# EAGLE design UWB nRF52840 DW3000 V1.1 (EAGLE 6.1)
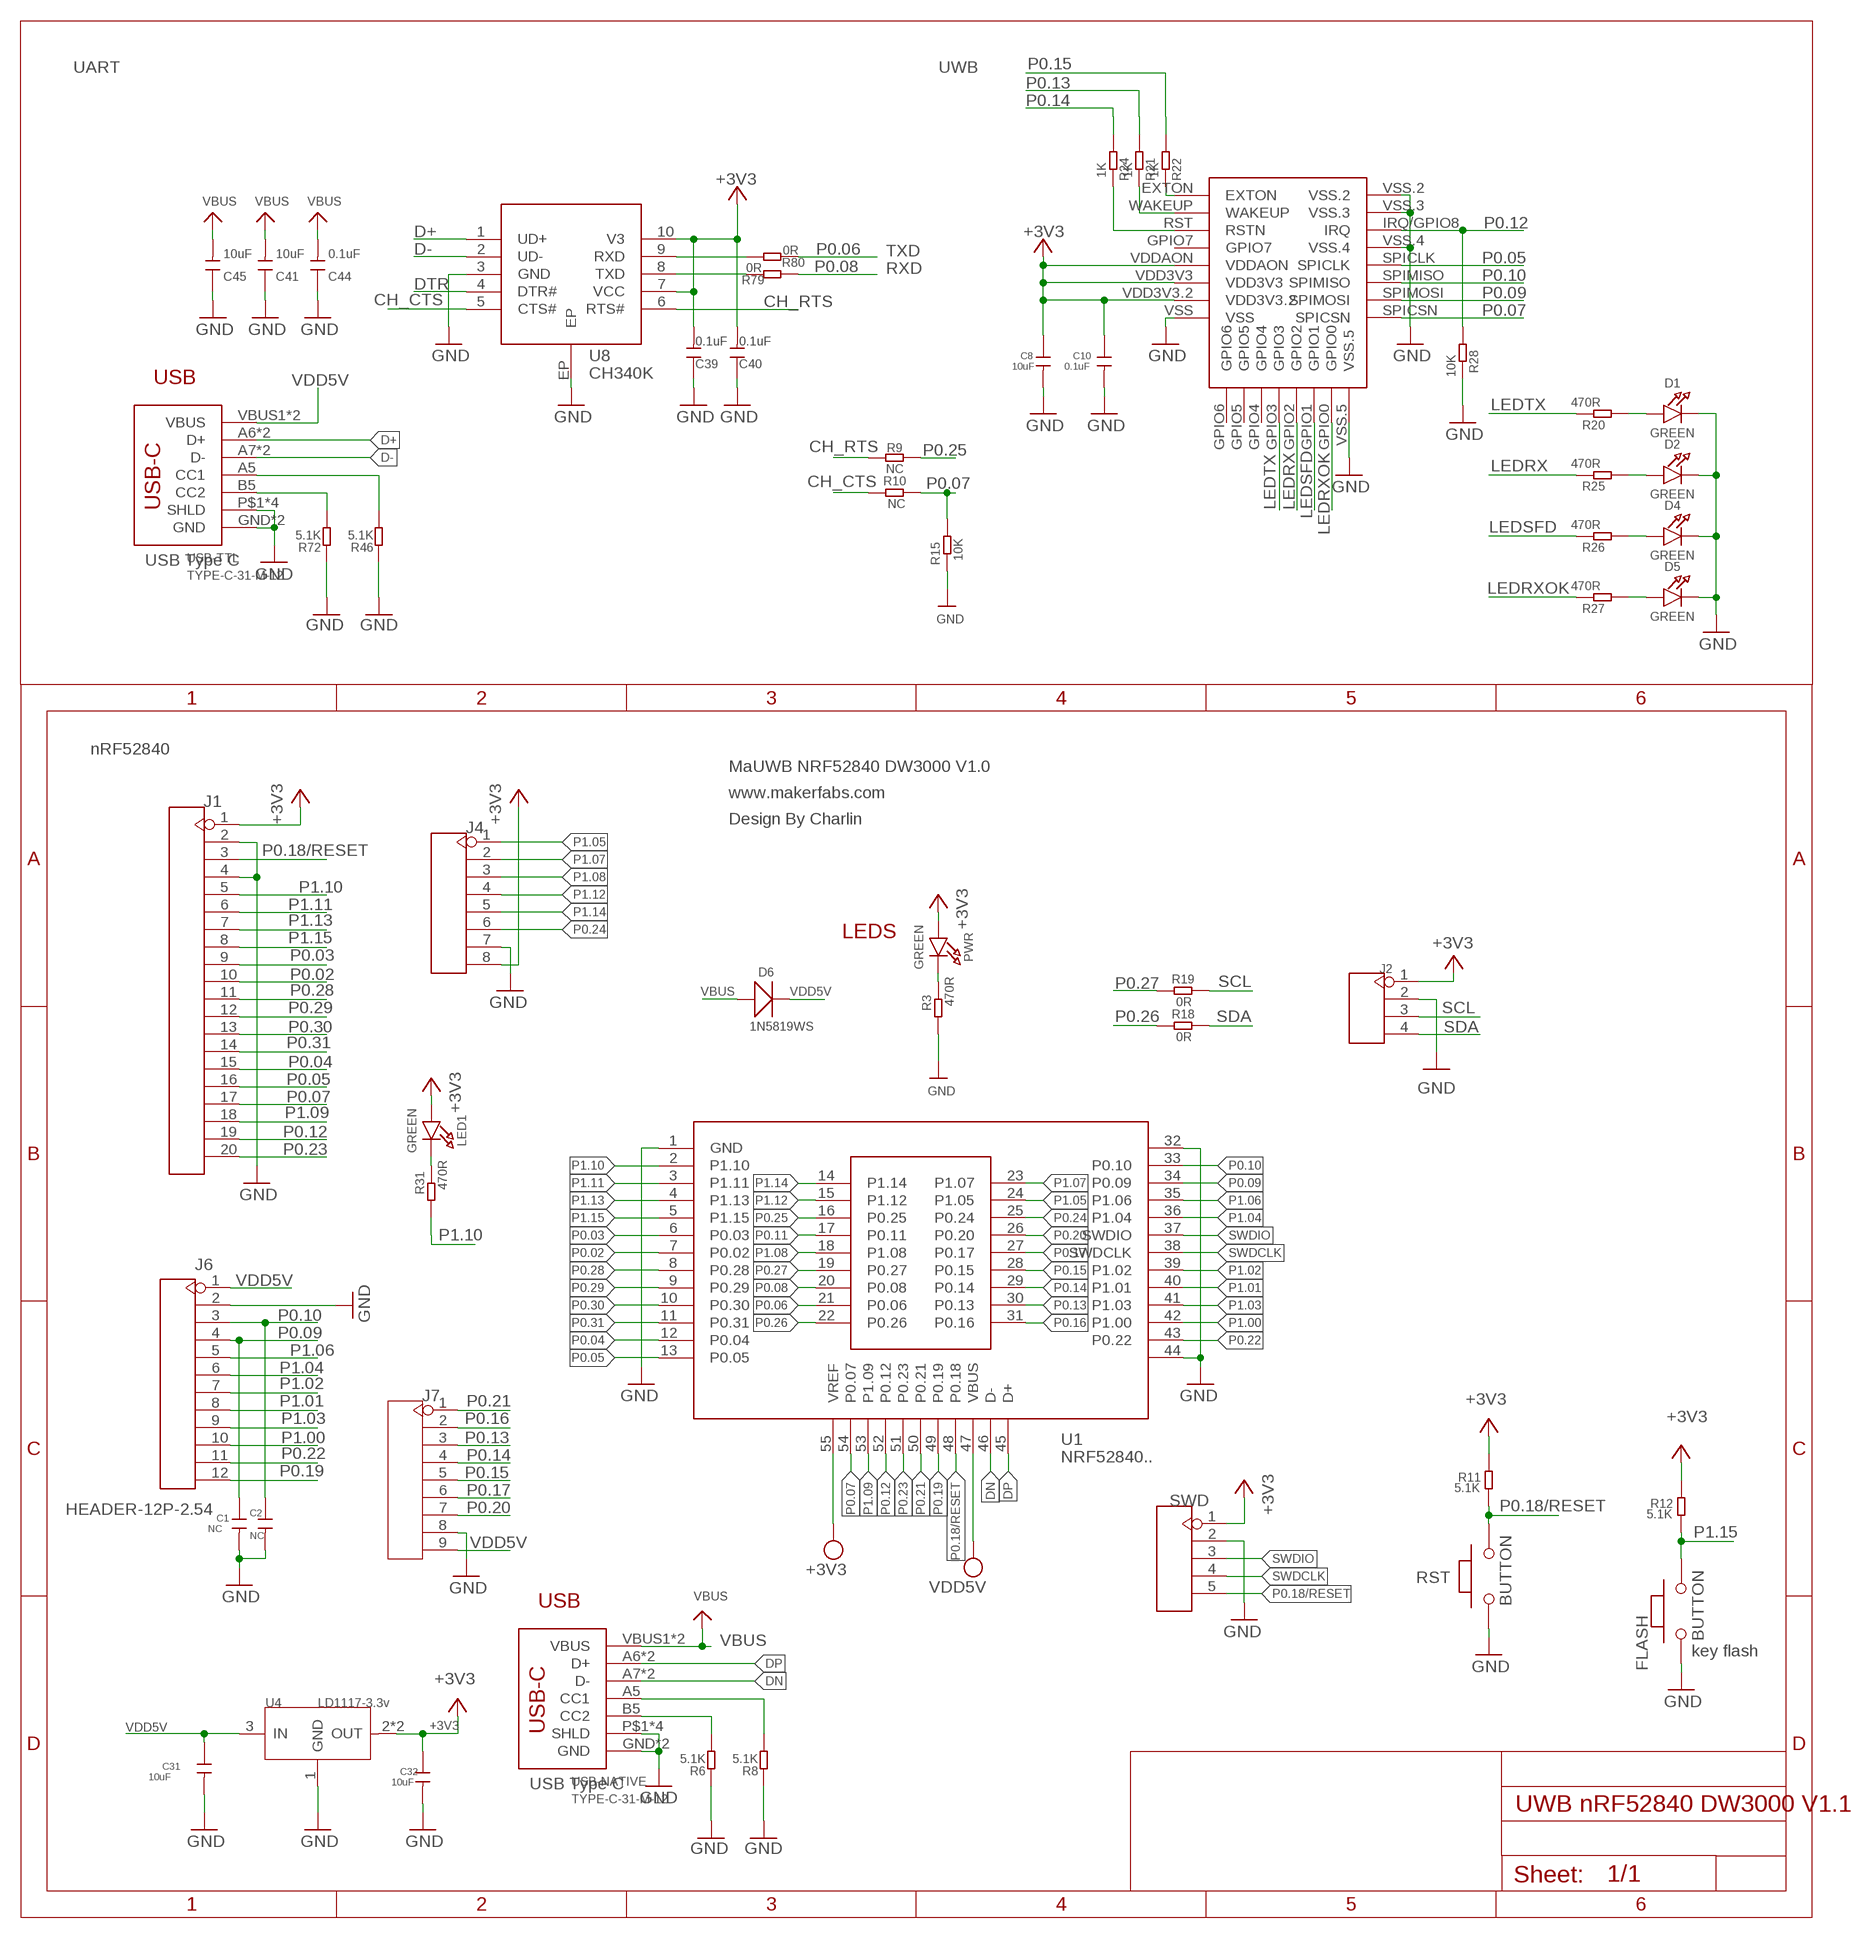
[diagram p0: schematic, sheet 1]

## Parts
C1  NC  C-0603  [C0603]
C2  NC  C-0603  [C0603]
C8  10uF  C-0603  [C0603]
C10  0.1uF  C-0603  [C0603]
C31  10uF  C-0603  [C0603]
C32  10uF  C-0603  [C0603]
C39  0.1uF  DISCRETE_C-0603  [DISCRETE_C0603]
C40  0.1uF  DISCRETE_C-0603  [DISCRETE_C0603]
C41  10uF  DISCRETE_C-0603  [DISCRETE_C0603]
C44  0.1uF  DISCRETE_C-0603  [DISCRETE_C0603]
C45  10uF  DISCRETE_C-0603  [DISCRETE_C0603]
D1  GREEN  LED0805_NOOUTLINE  [CHIPLED_0805_NOOUTLINE]
D2  GREEN  LED0805_NOOUTLINE  [CHIPLED_0805_NOOUTLINE]
D4  GREEN  LED0805_NOOUTLINE  [CHIPLED_0805_NOOUTLINE]
D5  GREEN  LED0805_NOOUTLINE  [CHIPLED_0805_NOOUTLINE]
D6  1N5819WS  D'0805'  [SOD323]
FLASH  BUTTON  PB157  [157SW]
J1  HEADER-20P-2.54  [20P-2.54]
J2  HEADER-4P-60/35MILROUND  [4P-65/35ROUND]
J4  HEADER-8P-2.54  [8P-2.54]
J6  HEADER-12P-2.54  [12P-2.54]
J7  HEADER-9P-2.54  [9P-2.54]
LED1  GREEN  LED0805_NOOUTLINE  [CHIPLED_0805_NOOUTLINE]
PWR  GREEN  LED0805_NOOUTLINE  [CHIPLED_0805_NOOUTLINE]
R3  470R  R-0603  [R0603]
R6  5.1K  DISCRETE_R-0603  [DISCRETE_R0603]
R8  5.1K  DISCRETE_R-0603  [DISCRETE_R0603]
R9  NC  R-0603  [R0603]
R10  NC  R-0603  [R0603]
R11  5.1K  R-0603  [R0603]
R12  5.1K  R-0603  [R0603]
R15  10K  R-0603  [R0603]
R18  0R  R-0603  [R0603]
R19  0R  R-0603  [R0603]
R20  470R  R-0603  [R0603]
R21  1K  R-0603  [R0603]
R22  1K  R-0603  [R0603]
R24  1K  R-0603  [R0603]
R25  470R  R-0603  [R0603]
R26  470R  R-0603  [R0603]
R27  470R  R-0603  [R0603]
R28  10K  R-0603  [R0603]
R31  470R  R-0603  [R0603]
R46  5.1K  DISCRETE_R-0603  [DISCRETE_R0603]
R72  5.1K  DISCRETE_R-0603  [DISCRETE_R0603]
R79  0R  R-0603  [R0603]
R80  0R  R-0603  [R0603]
RST  BUTTON  PB157  [157SW]
SWD  HEADER-5P-2.54  [5P-2.54]
U1  NRF52840..  [NRF52840..]
U4  LD1117-3.3v  LD1117'SOT89'  [SOT89]
U5  DWM1000  [DWM1000]
U8  CH340K  [ESOP-10-EP-150MIL]
USB-NATIVE  TYPE-C-31-M-12  [TYPE-C-31-M-12]
USB-TTL  TYPE-C-31-M-12  [TYPE-C-31-M-12]

## Nets
+3V3: C8.1 C10.1 C32.1 C39.2 C40.2 J1.1 J2.1 J4.8 LED1.A PWR.A R11.2 R12.2 SWD.1 U1.55(VREF) U4.2(OUT) U4.4(OUT) U5.VDD3V3 U5.VDD3V3.2 U5.VDDAON U8.7(VCC) U8.10(V3)
CH_CTS: R10.2 U8.5(CTS#)
CH_RTS: R9.2 U8.6(RTS#)
D+: U8.1(UD+) USB-TTL.A6(D+) USB-TTL.B6(D+)
D-: U8.2(UD-) USB-TTL.A7(D-) USB-TTL.B7(D-)
DN: U1.46(D-) USB-NATIVE.A7(D-) USB-NATIVE.B7(D-)
DP: U1.45(D+) USB-NATIVE.A6(D+) USB-NATIVE.B6(D+)
DTR: U8.4(DTR#)
GND: C1.2 C2.2 C8.2 C10.2 C31.2 C32.2 C39.1 C40.1 C41.1 C44.1 C45.1 D1.C D2.C D4.C D5.C FLASH.1 J1.2 J1.4 J2.2 J4.7 J6.2 J7.8 R3.2 R6.1 R8.1 R15.2 R28.1 R46.1 R72.1 RST.1 SWD.2 U1.1(GND) U1.32 U1.44 U4.1(GND) U5.VSS U5.VSS.2 U5.VSS.3 U5.VSS.4 U5.VSS.5 U8.3(GND) U8.EP USB-NATIVE.GND USB-NATIVE.GND2(GND) USB-NATIVE.P$1(SHLD) USB-NATIVE.P$2(SHLD) USB-NATIVE.P$3(SHLD) USB-NATIVE.P$4(SHLD) USB-TTL.GND USB-TTL.GND2(GND) USB-TTL.P$1(SHLD) USB-TTL.P$2(SHLD) USB-TTL.P$3(SHLD) USB-TTL.P$4(SHLD)
LEDRX: R25.1 U5.GPIO2
LEDRXOK: R27.1 U5.GPIO0
LEDSFD: R26.1 U5.GPIO1
LEDTX: R20.1 U5.GPIO3
N$1: LED1.C R31.1
N$2: D1.A R20.2
N$4: D2.A R25.2
N$5: PWR.C R3.1
N$6: D4.A R26.2
N$7: D5.A R27.2
N$10: R22.1 U5.EXTON
N$11: R21.1 U5.WAKEUP
N$12: R24.1 U5.RST(RSTN)
N$13: R46.2 USB-TTL.A5(CC1)
N$14: R72.2 USB-TTL.B5(CC2)
N$15: R8.2 USB-NATIVE.A5(CC1)
N$21: R6.2 USB-NATIVE.B5(CC2)
N$36: R80.2 U8.9(RXD)
N$37: R79.2 U8.8(TXD)
P0.02: J1.10 U1.7(P0.02)
P0.03: J1.9 U1.6(P0.03)
P0.04: J1.15 U1.12(P0.04)
P0.05: J1.16 U1.13(P0.05) U5.SPICLK
P0.06: R80.1 U1.21(P0.06)
P0.07: J1.17 R10.1 R15.1 U1.54(P0.07) U5.SPICSN
P0.08: R79.1 U1.20(P0.08)
P0.09: C1.1 J6.4 U1.34(P0.09) U5.SPIMOSI
P0.10: C2.1 J6.3 U1.33(P0.10) U5.SPIMISO
P0.11: U1.17(P0.11)
P0.12: J1.19 R28.2 U1.52(P0.12) U5.IRQ/GPIO8(IRQ)
P0.13: J7.3 R21.2 U1.30(P0.13)
P0.14: J7.4 R24.2 U1.29(P0.14)
P0.15: J7.5 R22.2 U1.28(P0.15)
P0.16: J7.2 U1.31(P0.16)
P0.17: J7.6 U1.27(P0.17)
P0.18/RESET: J1.3 R11.1 RST.2 SWD.5 U1.48(P0.18)
P0.19: J6.12 U1.49(P0.19)
P0.20: J7.7 U1.26(P0.20)
P0.21: J7.1 U1.50(P0.21)
P0.22: J6.11 U1.43(P0.22)
P0.23: J1.20 U1.51(P0.23)
P0.24: J4.6 U1.25(P0.24)
P0.25: R9.1 U1.16(P0.25)
P0.26: R18.2 U1.22(P0.26)
P0.27: R19.2 U1.19(P0.27)
P0.28: J1.11 U1.8(P0.28)
P0.29: J1.12 U1.9(P0.29)
P0.30: J1.13 U1.10(P0.30)
P0.31: J1.14 U1.11(P0.31)
P1.00: J6.10 U1.42(P1.00)
P1.01: J6.8 U1.40(P1.01)
P1.02: J6.7 U1.39(P1.02)
P1.03: J6.9 U1.41(P1.03)
P1.04: J6.6 U1.36(P1.04)
P1.05: J4.1 U1.24(P1.05)
P1.06: J6.5 U1.35(P1.06)
P1.07: J4.2 U1.23(P1.07)
P1.08: J4.3 U1.18(P1.08)
P1.09: J1.18 U1.53(P1.09)
P1.10: J1.5 R31.2 U1.2(P1.10)
P1.11: J1.6 U1.3(P1.11)
P1.12: J4.4 U1.15(P1.12)
P1.13: J1.7 U1.4(P1.13)
P1.14: J4.5 U1.14(P1.14)
P1.15: FLASH.2 J1.8 R12.1 U1.5(P1.15)
SCL: J2.3 R19.1
SDA: J2.4 R18.1
SWDCLK: SWD.4 U1.38(SWDCLK)
SWDIO: SWD.3 U1.37(SWDIO)
VBUS: C41.2 C44.2 C45.2 D6.+ USB-NATIVE.VBUS1(VBUS) USB-NATIVE.VBUS2(VBUS)
VDD5V: C31.1 D6.- J6.1 J7.9 U1.47(VBUS) U4.3(IN) USB-TTL.VBUS1(VBUS) USB-TTL.VBUS2(VBUS)
Unconnected: U5.GPIO4 U5.GPIO5 U5.GPIO6 U5.GPIO7

## Notes on the sheet
- UART | UWB
- TXD
- RXD
- USB
- USB Type C
- nRF52840
- MaUWB NRF52840 DW3000 V1.0
- www.makerfabs.com
- Design By Charlin
- LEDS
- USB
- key flash
- USB Type C

## Library data of the parts
C1 C2 C8 C10 C31 C32 = Discrete:C*: Ceramic Capacitors
C39-C41 C44 C45 = A9G:DISCRETE_C*: Ceramic Capacitors
D1 D2 D4 D5 LED1 PWR = microbuilder:LED: LED 0603 - 0603 Surface Mount Package 2mA: Green LED - Low Power (3.9mcd, 2ma, 1.7Vf) - Digikey: 475-2709-2-ND Orange LED - Low Power (9.8mcd, 2ma, 1.8Vf) - Digikey: 475-1194-2-ND Red LED - Low Power (5mcd, 2ma, 1.8Vf) - Digikey: 475-1195-2-ND Yellow LED - Low Power (7mcd, 2ma, 1.8Vf) - Digikey: 475-1196-2-ND 5mA: Blue LED - Low Power (17mcd, 5ma, 2.9Vf) - Digikey: LNJ937W8CRACT-ND 0805 - 0805 Surface Mount Package 2mA: Red LED (8.8mcd, 2mA, 1.8Vf, Clear) - Low Power [Digikey: 475-2510-1-ND] Green LED (5mcd, 2mA, 1.8Vf, Clear) - Low Power [Digikey: 475-2730-1-ND] Yellow LED (11.3mcd, 2mA, 1.8Vf, Clear) - Low Power [Digikey: 475-2555-1-ND] 20mA: Red LED (104mcd, 20mA, Diffused) - LS R976 [Digikey: 475-1278-6-ND] Red LED (12mcd, 20mA, 2.0Vf, Clear) - APT2012EC [Digikey: 754-1128-1-ND] Green LED (15mcd, 20mA, 2.2Vf, Clear) - APT2012GC [Digikey: 754-1131-1-ND] Orange LED (160mcd, 20mA, 2.1Vf, Clear) - APT2012SECK [Digikey: 754-1130-1-ND] 1206 - 1206 Surface Mount Package Green LED (26mcd, 20mA, Diffused) - LG N971 [Digikey: 475-1407-6-ND] Red LED (15mcd, 20mA, Diffused) - LH N974 [Digikey: 475-1416-6-ND] Cree - Cree High-Power Surface Mount LEDs XPEBWT-L1-0000-00D50 - White 111lm 350mA 2.9Vf 6200K 110° XTEAWT-00-0000-00000LEE3 - White 114lm 350mA 2.85Vf 5000K 115° Everlight - Everlight 45-21 Series Surface Mount LEDs 45-21/QK2C-B2832AC2CB2/2T - Warm White 2000mcd 20mA 3.25Vf 3050K 120° 45-21/LK2C-B38452C4CB2/2T - Nuetral White 2000mcd 20mA 3.25Vf 4150K 120° 45-21/LK2C-B50634C6CB2/2T - Cold White 2200mcd 20mA 3.25Vf 5650K 120° PLCC2 Reverse Mount LS T77K-J1L2-1-0-2-R18-Z - Red 11.25mcd 2mA 1.8Vf 630nm 120° LO T77K-L1M2-24-Z - Orange 19.6mcd 2mA 1.8Vf 606nm 120° LY T77K-K2M1-26-Z - Yellow 15.7mcd 2mA 1.8Vf 587nm 120°
D6 = Discrete:D*
FLASH RST = MySMD:PB157
J1 = Connector:HEADER-20P
J2 = Connector:HEADER-4P
J4 = Connector:HEADER-8P
J6 = Connector:HEADER-12P
J7 = Connector:HEADER-9P
R3 R9-R12 R15 R18-R22 R24-R28 R31 R79 R80 = Discrete:R*
R6 R8 R46 R72 = A9G:DISCRETE_R*
SWD = Connector:HEADER-5P
U1 = NRF52840:NRF52840..
U4 = IC:LD1117: Low Drop Fixed And Adjustable Positive Voltage Regulators http://www.datasheetcatalog.org/datasheet/SGSThomsonMicroelectronics/mXuqtqv.pdf
U5 = DWM1000:DWM1000
U8 = sale:CH340K
USB-NATIVE USB-TTL = sale:TYPE-C-31-M-12

## Net classes
0 default: width 0.203 mm, drill 0.203 mm
1 vbat: width 0.203 mm, drill 0.254 mm, clearance 0.152 mm

## Board
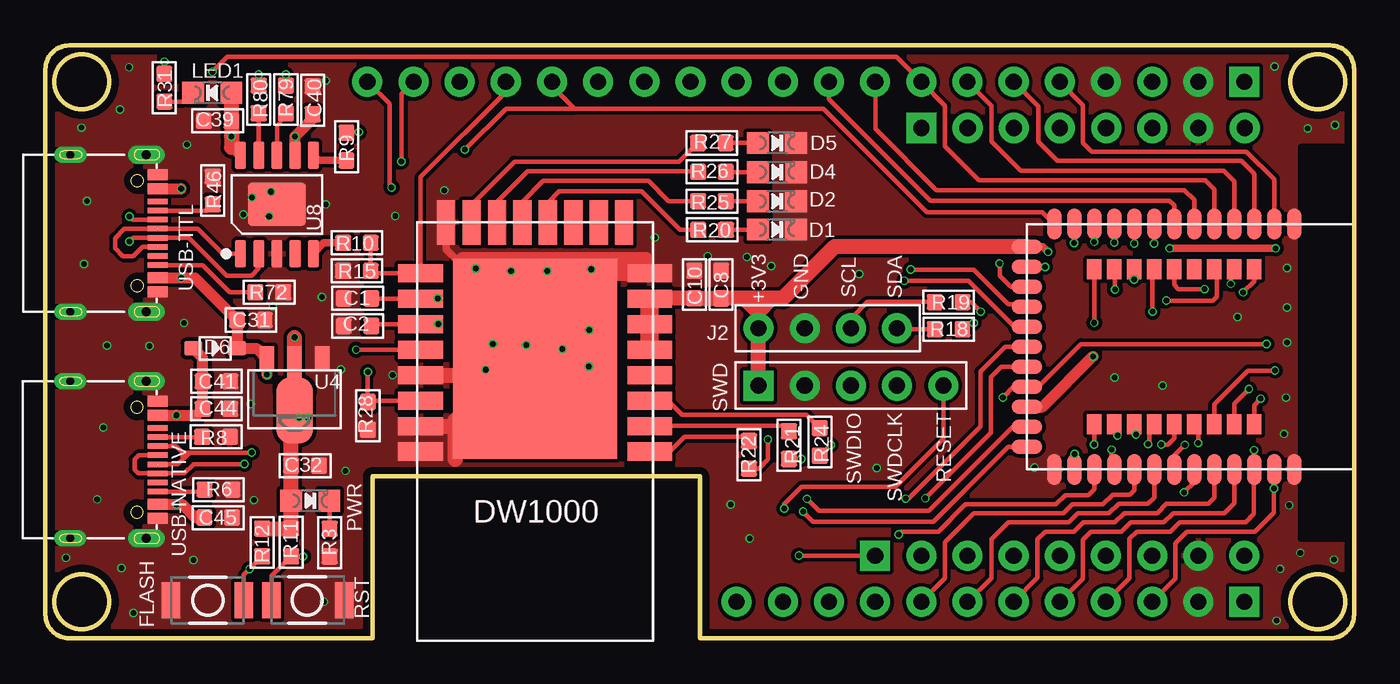
[diagram p1: board, top side]
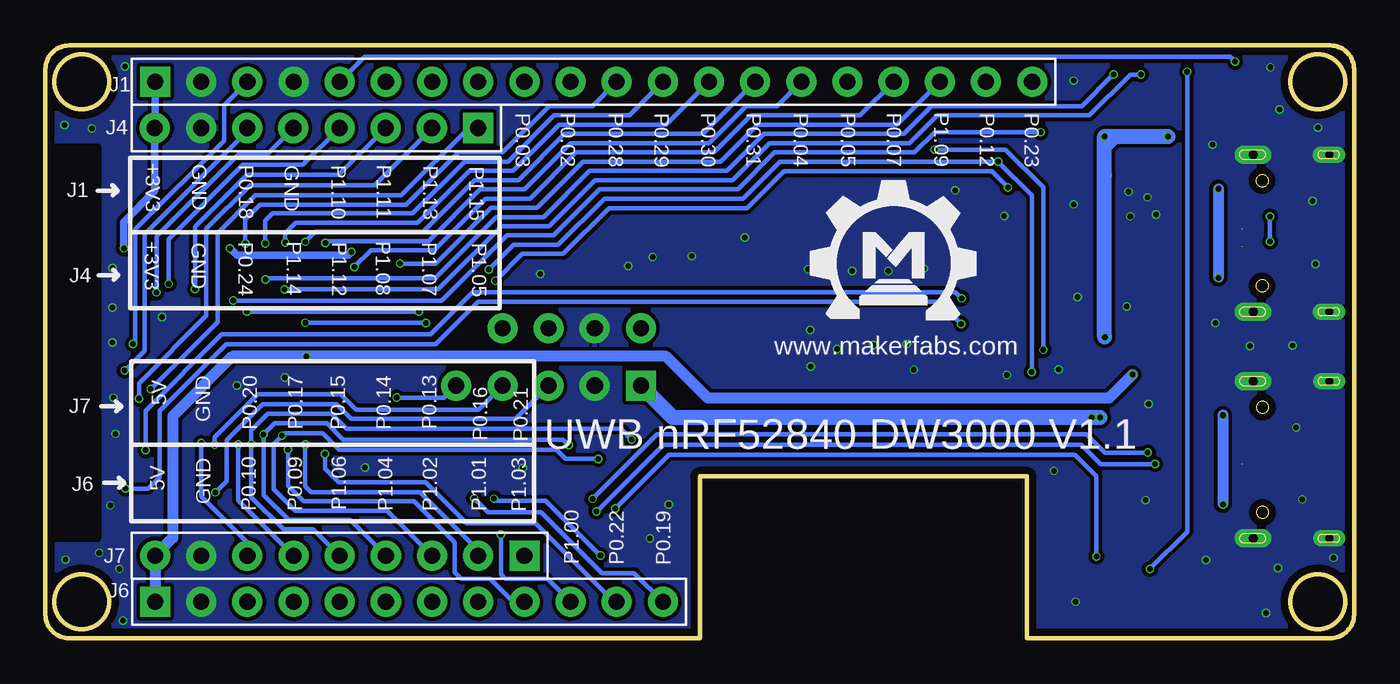
[diagram p2: board, bottom side, seen from below]

Size 72 x 32.6 mm. Coordinates in mm from the lower left corner, seen from the top.
Outline: 72,1.3 72,31.3 arc90 70.7,32.6 1.3,32.6 arc90 0,31.3 0,1.3 arc90 1.3,0 18,0 18,8.9 36,8.9 36,0 70.7,0 arc90 72,1.3
Outline: circle at 2,2 radius 1.5
Outline: circle at 2,30.6 radius 1.5
Outline: circle at 70,30.6 radius 1.5
Outline: circle at 70,2 radius 1.5
Copper layers (1*16): Top 0.035mm / dielectric 0.2mm / Bottom 0.035mm
Design rules: minimum track width 0.15mm, minimum drill 0.3mm, track to track 0.15mm, track to pad 0.15mm, pad to pad 0.15mm, via to via 0.15mm, smd to smd 0mil, copper to edge 0.4mm, drill to drill 0.4mm, minimum pad ring 3mil, minimum via ring 3mil, stop-mask expansion 4mil, vias tented up to drill 100mil, thermal gap 0mil
tRestrict: area 69.1,5.5 to 71.9,27
bRestrict: area 69.1,5.5 to 71.9,27

### Footprints (pad centres in the part's own frame; a part is rotated, then mirrored left to right if it is on the bottom)
C0603 = smd 0.889 x 0.889: 1 -0.762,0; 2 0.762,0
DISCRETE_C0603 = smd 0.889 x 0.889: 1 -0.762,0; 2 0.762,0
CHIPLED_0805_NOOUTLINE = smd 1.2 x 1.2: A 0,-1.05; C 0,1.05
SOD323 = smd 1 x 0.8: + -1.2,0; - 1.2,0
157SW = smd 1.016 x 1.981: 1 0,0; 2 4,0
20P-2.54 = drill 0.889 pad 1.651 square: 1 -25.4,0 | drill 0.889 pad 1.651: 2 -22.86,0; 3 -20.32,0; 4 -17.78,0; 5 -15.24,0; 6 -12.7,0; 7 -10.16,0; 8 -7.62,0; 9 -5.08,0; 10 -2.54,0; 11 0,0; 12 2.54,0; 13 5.08,0; 14 7.62,0; 15 10.16,0; 16 12.7,0; 17 15.24,0; 18 17.78,0; 19 20.32,0; 20 22.86,0
4P-65/35ROUND = drill 0.889 pad 1.651: 1 0,3.81; 2 0,1.27; 3 0,-1.27; 4 0,-3.81
8P-2.54 = drill 0.889 pad 1.651 square: 1 0,8.89 | drill 0.889 pad 1.651: 2 0,6.35; 3 0,3.81; 4 0,1.27; 5 0,-1.27; 6 0,-3.81; 7 0,-6.35; 8 0,-8.89
12P-2.54 = drill 0.889 pad 1.651 square: 1 0,13.97 | drill 0.889 pad 1.651: 2 0,11.43; 3 0,8.89; 4 0,6.35; 5 0,3.81; 6 0,1.27; 7 0,-1.27; 8 0,-3.81; 9 0,-6.35; 10 0,-8.89; 11 0,-11.43; 12 0,-13.97
9P-2.54 = drill 0.889 pad 1.651 square: 1 0,10.16 | drill 0.889 pad 1.651: 2 0,7.62; 3 0,5.08; 4 0,2.54; 5 0,0; 6 0,-2.54; 7 0,-5.08; 8 0,-7.62; 9 0,-10.16
R0603 = smd 0.889 x 0.889: 1 -0.762,0; 2 0.762,0
DISCRETE_R0603 = smd 0.889 x 0.889: 1 -0.762,0; 2 0.762,0
5P-2.54 = drill 0.889 pad 1.651 square: 1 0,5.08 | drill 0.889 pad 1.651: 2 0,2.54; 3 0,0; 4 0,-2.54; 5 0,-5.08
NRF52840.. = smd 1.7 x 0.8: 1 -6.75,5.7; 2 -6.75,4.6; 3 -6.75,3.5; 4 -6.75,2.4; 5 -6.75,1.3; 6 -6.75,0.2; 7 -6.75,-0.9; 8 -6.75,-2; 9 -6.75,-3.1; 10 -6.75,-4.2; 11 -6.75,-5.3; 12 -6.75,-6.4; 13 -6.75,-7.5; 32 6.75,5.7; 33 6.75,4.6; 34 6.75,3.5; 35 6.75,2.4; 36 6.75,1.3; 37 6.75,0.2; 38 6.75,-0.9; 39 6.75,-2; 40 6.75,-3.1; 41 6.75,-4.2; 42 6.75,-5.3; 43 6.75,-6.4; 44 6.75,-7.5 | smd 1.1 x 0.8: 14 -4.25,3.5; 15 -4.25,2.4; 16 -4.25,1.3; 17 -4.25,0.2; 18 -4.25,-0.9; 19 -4.25,-2; 20 -4.25,-3.1; 21 -4.25,-4.2; 22 -4.25,-5.3; 23 4.25,3.5; 24 4.25,2.4; 25 4.25,1.3; 26 4.25,0.2; 27 4.25,-0.9; 28 4.25,-2; 29 4.25,-3.1; 30 4.25,-4.2; 31 4.25,-5.3 | smd 0.8 x 1.7: 45 5.5,-9; 46 4.4,-9; 47 3.3,-9; 48 2.2,-9; 49 1.1,-9; 50 0,-9; 51 -1.1,-9; 52 -2.2,-9; 53 -3.3,-9; 54 -4.4,-9; 55 -5.5,-9
SOT89 = smd 0.8 x 1.4: 1 -1.524,-1.905; 3 1.524,-1.905 | smd 0.8 x 1.9: 2 0,-1.651 | smd 2.032 x 3.65: 4 0,0.94
DWM1000 = smd 2.45 x 1: EXTON -2.8,12.6; GPIO7 -2.8,8.4; IRQ/GPIO8 9.8,9.8; RST -2.8,9.8; SPICLK 9.8,7; SPICSN 9.8,2.8; SPIMISO 9.8,5.6; SPIMOSI 9.8,4.2; VDD3V3 -2.8,4.2; VDD3V3.2 -2.8,5.6; VDDAON -2.8,7; VSS -2.8,2.8; VSS.2 9.8,12.6; VSS.3 9.8,11.2; VSS.4 9.8,8.4; WAKEUP -2.8,11.2 | smd 9 x 11: GND 3.5,7.5 | smd 1 x 2.45: GPIO0 7,0; GPIO1 5.6,0; GPIO2 4.2,0; GPIO3 2.8,0; GPIO4 1.4,0; GPIO5 0,0; GPIO6 -1.4,0; VSS.5 8.4,0
ESOP-10-EP-150MIL = smd 1.5 x 0.6: 1 -2.7,2; 2 -2.7,1; 3 -2.7,0; 4 -2.7,-1; 5 -2.7,-2; 6 2.7,-2; 7 2.7,-1; 8 2.7,0; 9 2.7,1; 10 2.7,2 | smd 2.4 x 3.2: EP 0,0
TYPE-C-31-M-12 = smd 0.3 x 1.1: A5 -1.25,0.05; A6 -0.25,0.05; A7 0.25,0.05; A8 1.25,0.05; B5 1.75,0.05; B6 0.75,0.05; B7 -0.75,0.05; B8 -1.75,0.05 | smd 0.6 x 1.1: GND -3.225,0.05; GND2 3.225,0.05; VBUS1 -2.45,0.05; VBUS2 2.45,0.05 | drill 0.5 pad 1.016 long: P$1 4.32,-0.57; P$2 -4.32,-0.57 | drill 0.45 pad 0.9 long: P$3 -4.32,-4.75; P$4 4.32,-4.75

### Placement (x,y rotation side)
C1  17.18,18.69 180 top
C2  17.18,17.17 180 top
C8  37.18,19.45 90 top
C10  35.71,19.45 90 top
C31  11.3,17.5 0 top
C32  14.28,9.49 0 top
C39  9.48,28.45 0 top
C40  14.7,29.58 270 top
C41  9.41,14.12 180 top
C44  9.41,12.61 180 top
C45  9.5,6.63 180 top
D1  40.25,22.48 270 top
D2  40.25,24.03 270 top
D4  40.26,25.63 270 top
D5  40.25,27.24 270 top
D6  9.34,15.94 0 top
FLASH  6.91,2.08 0 top
J1  40.57,30.6 0 bottom
J2  43.05,17.05 90 top
J4  57.09,28.06 270 bottom
J6  52,2 90 bottom
J7  55.81,4.54 270 bottom
LED1  9.18,29.99 90 top
PWR  14.57,7.55 270 top
R3  15.63,5.25 270 top
R6  9.52,8.17 180 top
R8  9.39,11.07 180 top
R9  16.57,27.04 270 top
R10  17.14,21.74 180 top
R11  13.52,5.27 90 top
R12  11.93,5.27 90 top
R15  17.14,20.2 180 top
R18  49.69,16.99 0 top
R19  49.7,18.48 0 top
R20  36.68,22.46 0 top
R21  40.91,10.62 270 top
R22  38.71,10.09 270 top
R24  42.6,10.79 270 top
R25  36.67,24.04 0 top
R26  36.68,25.65 0 top
R27  36.66,27.24 0 top
R28  17.74,12.23 90 top
R31  6.54,30.27 90 top
R46  9.2,24.62 270 top
R72  12.31,19.03 180 top
R79  13.23,29.63 270 top
R80  11.73,29.63 270 top
RST  16.44,2.1 180 top
SWD  44.32,13.89 90 top
U1  63,16.03 270 top
U4  13.7,13.46 180 top
U5  30.44,22.86 180 top
U8  12.74,23.86 90 top
U$1  [MAKERFABS_0.3]  29.46,17.55 0 bottom
USB-NATIVE  6.11,9.81 270 top
USB-TTL  6.12,22.27 270 top

### Tracks (layer width: path | path; a pad name or v marks a point on that pad's centre or on a via)
+3V3  (via drill 0.3)
  Top 0.254: R11.2 | PWR.A | C32.1 | 13.52,12.34 U4.4 | U4.4 13.71,13.39 | 13.71,13.39 U4.2 | v13.71,16.55 | 13.74,13.35 13.71,13.39 | 33.26,18.69 U5.VDD3V3 | C8.1 | 40.58,18.69 39.97,18.69 39.95,18.67 | U4.4 13.71,12.4 v13.97,12.13
  Top 0.406: v61.85,21.44 v67.69,21.44 | U1.55 54.88,21.53 v55.16,21.25
  Top 0.61: 10.24,26.98 10.32,26.98 U8.10 | U8.7 v13.74,27.6 14.7,28.56 C40.2
  Top 0.813: R12.2 R11.2 | R11.2 PWR.A | PWR.A C32.1 | C32.1 13.52,12.34 | U4.2 v13.71,16.55 | U1.55 43.42,21.53 40.58,18.69 39.27,18.69 | 33.26,18.69 C10.1 C8.1 | 39.27,18.69 C8.1 | 39.27,18.69 39.24,18.66 J2.1 SWD.1 | 38.51,18.64 39.22,17.93 39.95,18.67 | LED1.A 10.23,28.46 C39.2 v10.24,27.59 v10.24,27.58 10.24,26.98
  Top 1.016: U5.VDD3V3 U5.VDD3V3.2 U5.VDDAON
  Bottom 0.254: 13.72,26.77 13.74,26.75 13.74,25.48 | 13.66,27.58 13.67,27.6 v13.74,27.6
  Bottom 0.406: v61.85,21.44 61.46,21.06 55.35,21.06 v55.16,21.25 | J1.1 J4.8 65.98,24.6 67.69,22.89 v67.69,21.45 v67.69,21.44 | 12.88,27.61 13.72,26.77
  Bottom 0.813: v10.24,27.58 13.66,27.58 | v13.97,12.13 v14.45,12.13 37.48,12.13 SWD.1 | v13.71,16.55 13.74,16.58 13.74,25.48 v13.74,27.6
CH_CTS
  Top 0.406: R10.2 15.32,21.74 U8.5
CH_RTS
  Top 0.406: R9.2 15.02,26.27 U8.6
D+  (2 unrouted)
  Top 0.254: U8.1 9.74,21.16 8.38,22.52 USB-TTL.A6 4.34,22.52 3.83,22.01 3.83,21.45 4.26,21.01 4.84,21.01 5.35,21.52 USB-TTL.B6
D-  (via drill 0.3)
  Top 0.254: U8.2 11.74,20.34 11.34,19.94 9.97,19.94 7.89,22.02 USB-TTL.A7 4.82,22.02 v4.62,21.82 | USB-TTL.B7 4.79,23.02 v4.62,23.19
  Bottom 0.254: v4.62,23.19 v4.62,21.82
DN  (via drill 0.3)  (1 unrouted)
  Top 0.254: USB-NATIVE.B7 7.2,10.56 7.55,10.21 | U1.46 53.23,11.63 48.62,7.01 42.55,7.01 v41.9,7.67 | v11.35,10.21 8,10.21 7.92,10.21 | 7.92,10.21 7.55,10.21 | USB-NATIVE.A7 7.28,9.56 7.92,10.21 | 7.55,9.84 7.55,10.21
  Bottom 0.254: v11.35,10.21 13.72,10.21 14.73,11.23 38.34,11.23 v41.9,7.67
DP  (via drill 0.3)
  Top 0.254: U1.45 52.97,10.53 48.84,6.4 42.24,6.4 v41.68,6.96 | USB-NATIVE.A6 5.14,10.06 4.9,9.83 4.9,9.27 5.11,9.07 USB-NATIVE.B6 7.64,9.06 8.15,9.58 v10.95,9.58
  Bottom 0.254: v10.95,9.58 13.95,9.58 15.01,10.64 38,10.64 v41.68,6.96
GND  (via drill 0.3)
  Top 0.254: 22.54,12.03 22.91,11.66 23.16,11.66
  Top 0.406: U5.VSS.5 22.04,21.39 23.34,20.09
  Top 0.813: U5.VSS.4 23.3,14.46 23.32,14.45 | U5.VSS.3 23.16,11.66 23.39,11.66 | 30.78,20.08 33.44,20.08 | 22.54,9.82 22.54,12.03 | 22.98,20.84 33.02,20.84
  other vias: 37.71,7.36 5.72,16.07 23.68,20.34 19.24,23.22 30.03,20.29 21.95,24.63 16.25,14.78 15.43,23.86 25.62,20.2 8.13,4.29 11.37,24.25 4.61,31.4 12.31,23.2 1.12,4.42 4.85,1.39 4.17,3.86 54.42,9.38 7.78,27.14 3.18,11.58 1.98,28.08 10.89,23.3 15.43,30.66 26.46,16.13 24.22,14.76 38.59,20.96 33.52,22.05 15.2,18.76 3.39,16.09 27.61,20.2 67.62,31.45 2.12,20.58 29.9,14.94 19.1,14.48 28.45,15.9 2.85,7.64 36.44,21.01 70.91,4.32 69.45,28.04 70.95,28.23 67.74,0.96 67.94,3.82 2.28,24.05 4.1,29.08 65.59,17.66 68.31,20.37 68.31,18.19 38.74,5.48 24.61,16.19 68.32,16.26 12.41,24.55 15.33,2 7.63,17.33 29.93,16.96 16.51,9.2 44.77,20.02 68.14,11.24 39.94,20.47 45.73,9.37 61.46,13.89 58.82,14.34 68.26,13.23 69.04,4.69 68.43,7.31 11.31,12.87 11.46,7.59 12.51,18.23
  pour Top (isolate 0.203): -8.7,-5.7 -8.7,49.1 97.2,49 97.4,-5.8
  pour Bottom (isolate 0.203): -8.4,-5.3 -8.4,49.5 96.9,49 98.1,-5.8
LEDRX
  Top 0.254: U5.GPIO2 26.24,24.01 27.38,25.15 33.17,25.15 34.29,24.03 35.9,24.03 R25.1
LEDRXOK
  Top 0.254: U5.GPIO0 23.44,23.85 25.81,26.21 34.87,26.21 R27.1
LEDSFD
  Top 0.254: U5.GPIO1 24.84,24 26.52,25.68 35.88,25.68 R26.1
LEDTX
  Top 0.254: U5.GPIO3 27.64,23.96 28.27,24.59 32.79,24.59 34.92,22.45 R20.1
N$1
  Top 0.254: R31.1 7.65,29.51 LED1.C
N$2
  Top 0.254: R20.2 37.46,22.48 D1.A
N$4
  Top 0.254: R25.2 37.44,24.03 D2.A
N$5
  Top 0.254: R3.1 15.63,7.54 PWR.C
N$6
  Top 0.254: R26.2 37.45,25.63 D4.A
N$7
  Top 0.254: R27.2 D5.A
N$10
  Top 0.254: U5.EXTON 34.34,10.27 35.15,11.07 38.94,11.07 R22.1
N$11
  Top 0.254: U5.WAKEUP 33.26,11.68 40.6,11.68 R21.1
N$12
  Top 0.254: U5.RST 34.26,13.06 35.03,12.29 41.87,12.29 R24.1
N$13
  Top 0.254: 8.86,23.52 R46.2 8.86,23.52 USB-TTL.A5
N$14
  Top 0.254: R72.2 10.13,19.03 8.64,20.52 USB-TTL.B5
N$15
  Top 0.254: R8.2 USB-NATIVE.A5
N$21
  Top 0.254: 8.65,8.06 R6.2 8.65,8.06 USB-NATIVE.B5
N$36
  Top 0.254: U8.9 11.74,28.66 R80.2
N$37
  Top 0.254: U8.8 12.74,28.16 R79.2
P0.02
  Top 0.254: U1.7 62.1,23.8 61.84,24.06 48.69,24.06 43.11,29.64 J1.10
P0.03
  Top 0.254: U1.6 63.2,24.12 62.67,24.64 49.02,24.64 45.66,28 J1.9
P0.04  (via drill 0.3)
  Top 0.254: U1.12 v56.6,21.73
  Bottom 0.254: v56.6,21.73 56.49,21.84 50.93,21.84 48.08,24.69 45.64,24.69 43.1,27.23 35.48,27.23 33.45,29.26 31.75,29.26 J1.15
P0.05  (via drill 0.3)
  Top 0.254: 55.48,22.76 U1.13 54.84,23.44 48.49,23.44 42.81,29.12 29.1,29.12 | 29.1,29.12 27.87,30.36 J1.16 | U5.SPICLK 18.37,15.87 v17.1,15.86 | 29.1,29.12 25.33,29.12 v23.07,26.86
  Bottom 0.254: v17.1,15.86 17.1,24.79 19.18,26.87 v23.07,26.87 v23.07,26.86
P0.06  (via drill 0.3)
  Top 0.254: U1.21 58.84,20.24 58.84,20.23 v58.84,19.18 | v11.73,31 11.73,30.19 R80.1
  Bottom 0.254: v58.84,19.18 50.39,19.18 46.91,22.66 44.3,22.66 41.76,25.2 34.19,25.2 32.16,27.23 24.46,27.23 22.94,28.75 14.55,28.75 12.31,31 v11.73,31
P0.07  (via drill 0.3)
  Top 0.254: R10.1 R15.1 18.04,20.07 U5.SPICSN 20.64,25.37 25.33,30.05 J1.17 | R10.1 | U1.54 54.99,20.43 v55.01,20.42
  Bottom 0.254: J1.17 27.18,28.75 33.17,28.75 35.2,26.72 42.8,26.72 45.34,24.18 47.78,24.18 50.62,21.34 54.09,21.34 v55.01,20.42
P0.08  (via drill 0.3)
  Top 0.254: U1.20 v59.9,19.74 v59.9,19.73 | v13.24,31 13.24,30.19 R79.1
  Bottom 0.254: v59.9,19.73 59.85,19.79 50.57,19.79 47.19,23.16 44.6,23.16 42.06,25.7 34.49,25.7 32.46,27.74 24.77,27.74 23.24,29.26 14.98,29.26 v13.24,31
P0.09  (via drill 0.3)
  Top 0.254: J6.4 59.65,3.3 59.65,5.47 60.04,5.87 61.9,5.87 62.41,6.38 66.04,6.38 66.5,6.83 U1.34 v66.5,10.34 | C1.1 17.96,18.66 U5.SPIMOSI 21.56,18.66 v21.59,18.69
  Bottom 0.254: v21.59,18.69 21.92,19.02 48.49,19.02 50.8,16.71 62.31,16.71 66.5,12.52 v66.5,10.34
P0.10  (via drill 0.3)
  Top 0.254: U1.33 | C2.1 18.03,17.27 U5.SPIMISO 21.61,17.27 v21.61,17.27 | J6.3 62.15,3.26 62.15,5.23 62.79,5.87 66.55,5.87 67.59,6.91 v67.59,8.23 | v67.59,8.23 67.59,9.27 U1.33 | U1.33 67.59,9.29 v67.59,8.23
  Bottom 0.254: v21.61,17.27 22.86,18.52 48.18,18.52 50.52,16.18 62.05,16.18 65.71,12.52 65.71,8.87 66.34,8.23 v67.59,8.23
P0.12  (via drill 0.3)
  Top 0.254: U1.52 53.87,18.36 52.98,18.36 51.08,20.27 47.61,20.27 v47.6,20.28 | U5.IRQ/GPIO8 17.81,13.06 R28.2 17.74,14.63 v17.73,14.63 | J1.19 19.58,29.93 v19.58,26.21
  Bottom 0.254: v17.73,14.63 17.73,24.36 v19.58,26.21 31.6,26.21 33.63,24.18 41.25,24.18 43.79,21.64 46.24,21.64 v47.6,20.28
P0.13  (via drill 0.3)
  Top 0.254: U1.30 | U1.30 58.8,11.31 v58.98,11.14 | R21.2 | R21.2 v41.58,9.86
  Bottom 0.254: J7.3 53.2,7.01 58.27,7.01 59.44,8.18 59.44,10.68 v58.98,11.14 58.84,11.28 56.74,11.28 55.83,10.36 43.89,10.36 43.38,9.86 v41.58,9.86
P0.14  (via drill 0.3)
  Top 0.254: U1.29 59.9,11.31 v60,11.21 | R24.2 43.19,10.62 v43.2,10.62
  Bottom 0.254: J7.4 55.23,6.5 58.62,6.5 59.99,7.87 v59.99,11.21 v60,11.21 59.4,11.81 56.52,11.81 55.63,10.92 43.51,10.92 v43.2,10.62
P0.15  (via drill 0.3)
  Top 0.254: U1.28 60.73,11.51 60.73,10.73 v60.67,10.67 | R22.2 39.25,9.32 39.75,9.83 v39.75,10.92
  Bottom 0.254: J7.5 57.26,5.99 58.9,5.99 60.67,7.76 v60.67,10.67 60.67,11.44 59.77,12.34 56.26,12.34 55.42,11.51 40.34,11.51 v39.75,10.92
P0.16  (via drill 0.3)
  Top 0.254: U1.31 v57.7,10.66 v57.7,10.65
  Bottom 0.254: J7.2 48.19,4.83 51.38,8.03 57.38,8.03 57.7,8.35 v57.7,10.65
P0.17  (via drill 0.3)
  Top 0.254: U1.27 62.1,10.99 61.75,10.65 v61.39,10.65
  Bottom 0.254: J7.6 61.39,7.58 v61.39,10.65
P0.18/RESET  (via drill 0.3)
  Top 0.254: RST.2 12.44,3.42 R11.1 14.17,4.51 v14.18,4.5 | SWD.5 49.4,10.97 46.76,8.33 41.6,8.33 40.64,7.37 v40.64,7.14 | v67.18,16.18 56.97,16.18 54.62,13.83 U1.48 53.99,13.82 53.26,13.82 v52.68,13.23
  Bottom 0.254: v14.18,4.5 14.18,8.89 15.37,10.08 37.69,10.08 v40.64,7.14 | J1.3 62.18,29.31 62.18,27.36 67.06,22.48 67.06,16.31 v67.18,16.18 | v52.68,13.23 50.06,13.23 SWD.5
P0.19  (via drill 0.3)
  Top 0.254: U1.49 52.6,14.93 52.02,14.35 52.02,11.3 v48.41,7.7
  Bottom 0.254: J6.12 39.62,3.58 41.38,3.58 44.73,6.93 47.65,6.93 v48.41,7.7
P0.20  (via drill 0.3)
  Top 0.254: U1.26 63.43,11.55 v63.43,10.73
  Bottom 0.254: J7.7 60.89,5.26 63.42,7.8 v63.42,10.72 v63.43,10.73
P0.21  (via drill 0.3)
  Top 0.254: J7.1 v41.46,4.54 | U1.50 52.81,16.03 51.44,14.66 51.44,11.63 47.47,7.67 v47.32,7.67
  Bottom 0.254: v47.32,7.67 47.22,7.57 44.48,7.57 v41.46,4.54
P0.22  (via drill 0.3)
  Top 0.254: U1.43 56.62,9.3 v56.62,10.14
  Bottom 0.254: J6.11 40.71,2 45.03,6.33 48.82,6.33 51.08,8.59 55.88,8.59 56.62,9.32 v56.62,10.14
P0.23  (via drill 0.3)
  Top 0.254: U1.51 53.3,17.13 50.77,19.66 v47.24,19.66 | J1.20 18.92,29.39 18.92,24.92 v19.04,24.8
  Bottom 0.254: v19.04,24.8 19.93,25.68 31.37,25.68 33.4,23.65 41,23.65 43.51,21.13 45.77,21.13 v47.24,19.66
P0.24  (via drill 0.3)
  Top 0.254: U1.25 64.3,12.86 66.16,14.72 v67.64,14.72
  Bottom 0.254: J4.6 60.9,27.87 66.55,22.23 66.55,15.81 v67.64,14.72
P0.25  (via drill 0.3)
  Top 0.254: v17.25,27.83 16.6,27.83 R9.1 | U1.16 64.44,20.14 64.44,18.77 64.24,18.57 v61.67,18.57
  Bottom 0.254: v17.25,27.83 23.07,27.83 24.18,26.72 31.88,26.72 33.91,24.69 41.5,24.69 44.04,22.15 46.61,22.15 50.19,18.57 v61.67,18.57
P0.26  (via drill 0.3)
  Top 0.254: U1.22 v57.7,17.36 v57.71,17.35 | v51.07,17.33 50.7,17.33 R18.2
  Bottom 0.254: v57.71,17.35 51.09,17.35 v51.07,17.33
P0.27  (via drill 0.3)
  Top 0.254: v60.91,17.96 60.91,20.19 U1.19 | R19.2 50.93,18.48 v51.46,17.96
  Bottom 0.254: v60.91,17.96 v51.46,17.96
P0.28  (via drill 0.3)
  Top 0.254: U1.8 | U1.8 v61,21.71
  Bottom 0.254: v61,21.71 61,23.05 60.2,23.85 52.15,23.85 49.28,26.72 46.84,26.72 44.3,29.26 41.91,29.26 J1.11
P0.29  (via drill 0.3)
  Top 0.254: U1.9 v59.91,21.71
  Bottom 0.254: v59.91,21.71 59.91,22.95 59.49,23.37 51.79,23.37 48.95,26.21 46.56,26.21 44.02,28.75 39.88,28.75 J1.12
P0.30  (via drill 0.3)
  Top 0.254: U1.10 v58.81,21.76
  Bottom 0.254: J1.13 37.84,28.25 43.74,28.25 46.28,25.7 48.67,25.7 51.51,22.86 58.23,22.86 58.81,22.28 v58.81,21.76
P0.31  (via drill 0.3)
  Top 0.254: U1.11 v57.71,21.8
  Bottom 0.254: J1.14 35.81,27.74 43.43,27.74 45.97,25.2 48.39,25.2 51.23,22.35 57.16,22.35 v57.71,21.8
P1.00  (via drill 0.3)
  Top 0.254: U1.42 57.7,8.2 57.38,7.87 56.11,7.87 55.6,7.37 50.62,7.37 49.12,5.87 47.11,5.87 v46.95,5.71
  Bottom 0.254: J6.10 44.39,3.28 46.71,3.28 46.94,3.5 v46.94,5.7 v46.95,5.71
P1.01
  Top 0.254: U1.40 59.9,8.13 59.66,7.9 58.73,7.9 58.19,7.37 56.49,7.37 56.01,6.88 51.87,6.88 51.32,6.88 51.08,6.88 49.48,5.28 49.48,3.29 J6.8
P1.02
  Top 0.254: U1.39 61,7.74 60.66,7.39 59.05,7.39 58.52,6.86 56.79,6.86 56.31,6.38 52.98,6.38 52.04,5.44 52.04,3.31 J6.7
P1.03  (via drill 0.3)
  Top 0.254: 58.77,9.31 U1.41 58.65,9.43 v58.65,10.37
  Bottom 0.254: J6.9 46.27,2 47.55,3.28 49.12,3.28 49.48,3.63 49.48,5.28 51.71,7.52 57.78,7.52 58.65,8.39 v58.65,10.37
P1.04
  Top 0.254: J6.6 54.58,3.31 54.58,5.43 55.02,5.87 56.59,5.87 57.1,6.38 58.85,6.38 59.36,6.88 61.16,6.88 61.67,7.39 63.98,7.39 64.31,7.72 64.31,9.27 U1.36
P1.05  (via drill 0.3)
  Top 0.254: U1.24 65.4,12.89 v66.21,13.7
  Bottom 0.254: J4.1 48.72,28.06 52.43,24.36 60.46,24.36 62.53,22.28 62.53,17.38 v66.21,13.7
P1.06
  Top 0.254: J6.5 57.08,3.27 57.08,5.42 57.53,5.87 59.21,5.87 59.72,6.38 61.54,6.38 62.05,6.88 64.87,6.88 65.41,7.42 U1.35
P1.07  (via drill 0.3)
  Top 0.254: U1.23 66.5,12.82 v66.85,13.17
  Bottom 0.254: J4.2 53.88,24.92 60.74,24.92 63.14,22.52 63.14,17.73 66.85,14.02 v66.85,13.18 v66.85,13.17
P1.08  (via drill 0.3)
  Top 0.254: U1.18 62.1,19.43 62.34,19.19 v63.77,19.19
  Bottom 0.254: J4.3 55.86,25.48 60.91,25.48 63.77,22.62 v63.77,19.19
P1.09  (via drill 0.3)
  Top 0.254: U1.53 53.11,19.33 52.5,19.94 52.5,20.59 v52.49,20.6
  Bottom 0.254: v52.49,20.6 50.54,20.6 47.47,23.67 44.96,23.67 42.42,26.21 34.85,26.21 32.82,28.25 25.14,28.25 J1.18
P1.10  (via drill 0.3)
  Top 0.254: U1.2 67.6,25.24 66.08,26.76 57.58,26.76 57.09,27.25 57.09,29.32 J1.5 | v6.55,31.71 R31.2
  Bottom 0.254: J1.5 54.44,31.97 6.81,31.97 v6.55,31.71
P1.11
  Top 0.254: U1.3 66.5,25.55 65.79,26.26 55.66,26.26 54.62,27.31 54.62,29.25 J1.6
P1.12  (via drill 0.3)
  Top 0.254: U1.15 65.22,20.1 v65.22,19.49
  Bottom 0.254: J4.4 57.84,26.04 61.14,26.04 65.22,21.95 v65.22,19.49
P1.13
  Top 0.254: U1.4 65.4,25.13 64.82,25.71 53.68,25.71 52.05,27.34 52.05,29.29 J1.7
P1.14  (via drill 0.3)
  Top 0.254: U1.14 66.5,19.63 v65.89,19.02
  Bottom 0.254: J4.5 59.83,26.59 61.4,26.59 65.89,22.09 v65.89,19.02
P1.15  (via drill 0.3)
  Top 0.254: U1.5 64.3,24.7 63.8,25.2 51.37,25.2 49.5,27.07 49.5,29.29 J1.8 46.82,31.97 9.99,31.97 v9.18,31.15 | FLASH.2 10.91,3.49 v11.23,3.81 R12.1
  Bottom 0.254: v9.18,31.15 9.18,5.86 v11.23,3.81
SCL
  Top 0.254: J2.3 44.32,17.57 45.24,18.49 R19.1
SDA
  Top 0.254: R18.1 46.92,16.99 J2.4
SWDCLK  (via drill 0.3)
  Top 0.254: U1.38 62.1,10.05 v62.69,10.64
  Bottom 0.254: SWD.4 48.18,12.57 54.91,12.57 55.75,13.41 60.33,13.41 62.69,11.05 v62.69,10.64
SWDIO  (via drill 0.3)
  Top 0.254: U1.37 63.2,8.58 v62.64,8.02
  Bottom 0.254: SWD.3 46.15,12.06 55.17,12.06 55.98,12.88 60.05,12.88 62.03,10.9 62.03,8.63 v62.64,8.02
VBUS  (via drill 0.3)  (1 unrouted)
  Top 0.254: 7.22,12.26 v7.21,12.26 | 7.26,7.36 v7.21,7.36
  Top 0.61: USB-NATIVE.VBUS2 7.26,7.36 | v7.21,7.36 7.52,7.36 8.25,6.63 C45.2 | USB-NATIVE.VBUS1 v7.21,12.26 | 7.22,12.26 8.29,12.26 C44.2 C41.2 8.65,15.43 D6.+
  Bottom 0.254: 7.21,7.4 v7.21,7.36
  Bottom 0.61: v7.21,12.26 7.21,7.4
VDD5V  (via drill 0.3)
  Top 0.254: 54.03,12.7 U1.47 | v7.47,24.72
  Top 0.61: 54.03,12.7 54.84,12.7 v57.63,15.49 | v57.63,15.49 | USB-TTL.VBUS1 v7.46,24.72 v7.47,24.72 | USB-TTL.VBUS2 v7.47,19.82 | v7.47,19.82 | v7.47,19.82 8.22,19.82 C31.1 D6.- | D6.- | D6.- 11.61,15.94 U4.3 v12.18,14.51 v12.19,14.5
  Bottom 0.254: 7.47,19.85 v7.47,19.82
  Bottom 0.61: J6.1 J7.9 65,5.51 65,12.22 61.72,15.49 v57.63,15.49 37.85,15.49 35.56,13.21 13.48,13.21 v12.19,14.5 | v7.47,24.72 7.47,19.85

### Text on the board
tNames: GND | SCL | SDA | +3V3 | SWDIO | SWDCLK | RESET
bNames: P0.23 | P0.12 | P1.09 | P0.07 | P0.05 | P0.04 | P0.31 | P0.30 | P0.29 | P0.28 | P0.02 | P0.03 | P1.15 | P1.13 | P1.11 | P1.10 | GND | P0.18 | GND | +3V3 | J1 | P1.05 | P1.07 | P1.08 | P1.12 | P1.14 | P0.24 | GND | +3V3 | J4 | www.makerfabs.com | P0.21 | P0.16 | P0.13 | P0.14 | P0.15 | P0.17 | P0.20 | GND | 5V | J7 | UWB nRF52840 DW3000 V1.1 | P1.03 | P1.01 | P1.02 | P1.04 | P1.06 | P0.09 | P0.10 | GND | 5V | J6 | P0.19 | P0.22 | P1.00